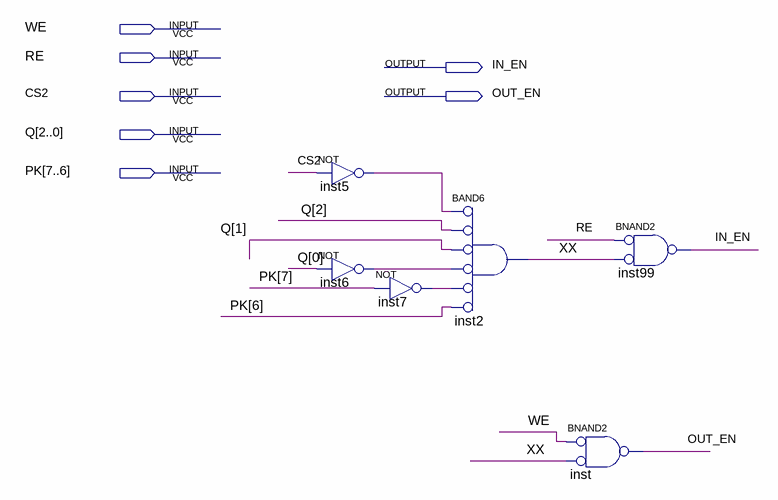
[diagram p0: schematic sheet]
// Quartus schematic NANDs.bdf as structural Verilog: 6 symbols, 7 pins
module NANDs (
  input  WE,
  input  RE,
  input  CS2,
  input  [2:0] Q,
  input  [7:6] PK,
  output IN_EN,
  output OUT_EN
);

  wire inst5_out, inst6_out, inst7_out, XX;

  not inst5 (inst5_out, CS2);
  not inst6 (inst6_out, Q[0]);
  not inst7 (inst7_out, PK[7]);
  and inst2 (XX, ~inst5_out, ~Q[2], ~Q[1], ~inst6_out, ~inst7_out, ~PK[6]);  // BAND6
  nand inst99 (IN_EN, ~RE, ~XX);  // BNAND2
  nand inst (OUT_EN, ~WE, ~XX);  // BNAND2
endmodule
